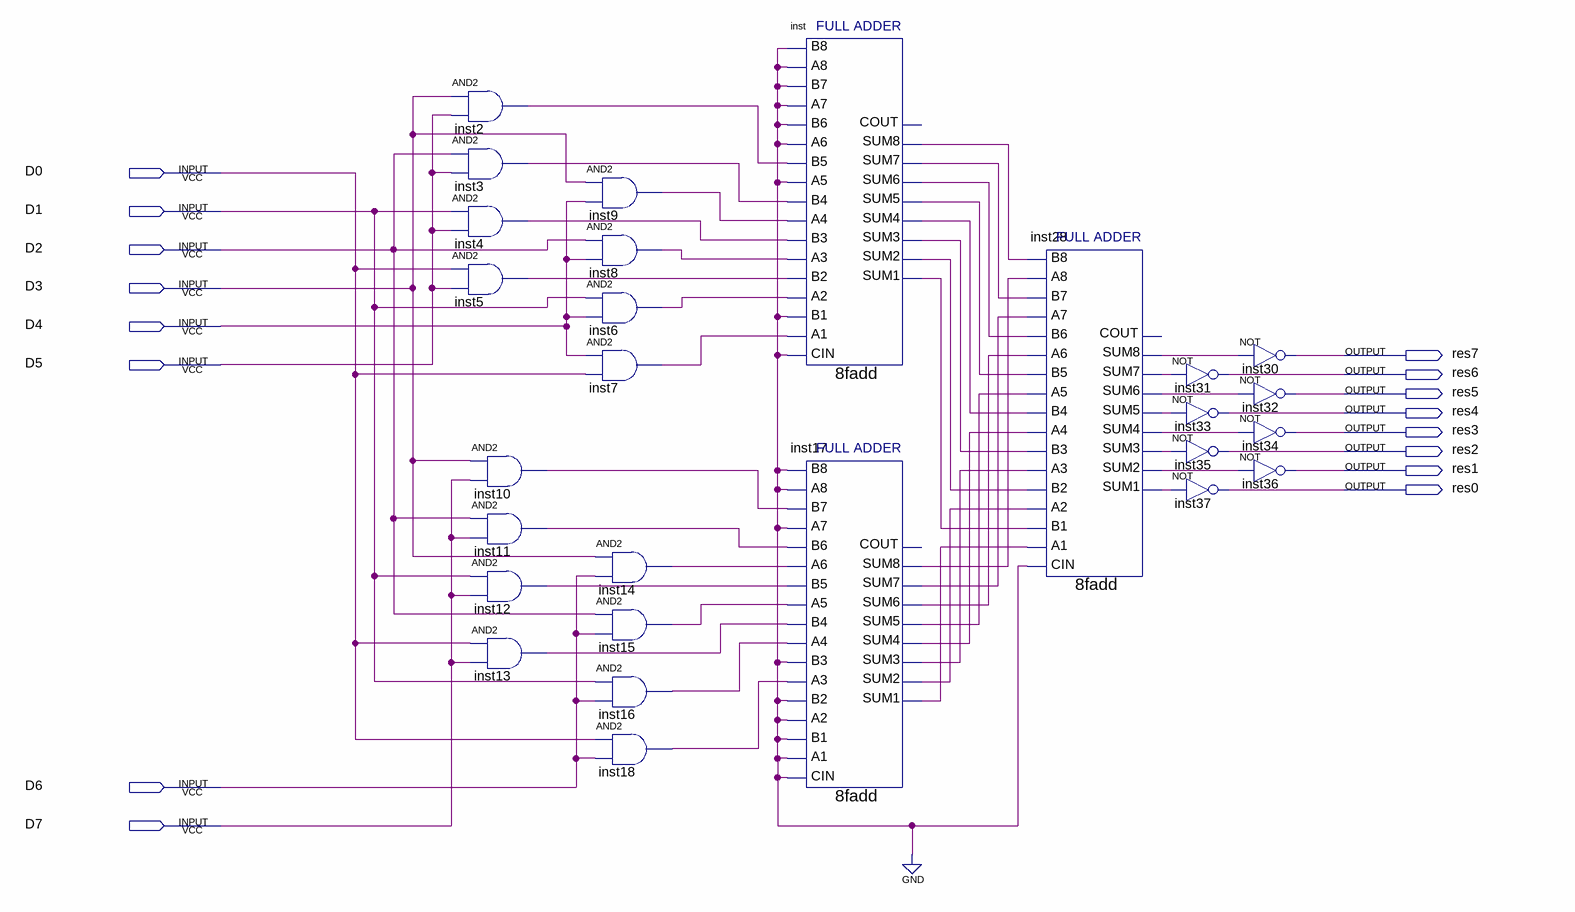
[diagram p0: schematic sheet]
// Quartus schematic Multiplier.bdf as structural Verilog: 27 symbols, 16 pins
module Multiplier (
  input  D0,
  input  D1,
  input  D2,
  input  D3,
  input  D4,
  input  D5,
  input  D6,
  input  D7,
  output res7,
  output res6,
  output res5,
  output res4,
  output res3,
  output res2,
  output res1,
  output res0
);

  wire inst2_out, inst3_out, inst4_out, inst5_out, inst6_out, inst7_out, inst8_out, inst9_out, inst10_out,
       inst11_out, inst12_out, inst13_out, inst14_out, inst15_out, inst16_out, inst17_sum1, inst17_sum2,
       inst17_sum3, inst17_sum4, inst17_sum5, inst17_sum6, inst17_sum7, inst17_sum8, inst18_out, inst28_sum1,
       inst28_sum2, inst28_sum3, inst28_sum4, inst28_sum5, inst28_sum6, inst28_sum7, inst28_sum8, inst_sum1,
       inst_sum2, inst_sum3, inst_sum4, inst_sum5, inst_sum6, inst_sum7, inst_sum8;

  and inst2 (inst2_out, D3, D5);
  and inst3 (inst3_out, D2, D5);
  and inst4 (inst4_out, D1, D5);
  and inst5 (inst5_out, D0, D5);
  and inst10 (inst10_out, D3, D7);
  and inst11 (inst11_out, D2, D7);
  and inst12 (inst12_out, D1, D7);
  and inst13 (inst13_out, D0, D7);
  and inst9 (inst9_out, D3, D4);
  and inst8 (inst8_out, D2, D4);
  and inst6 (inst6_out, D1, D4);
  and inst7 (inst7_out, D4, D0);
  and inst14 (inst14_out, D3, D6);
  and inst15 (inst15_out, D2, D6);
  and inst16 (inst16_out, D1, D6);
  and inst18 (inst18_out, D0, D6);
  \8fadd  inst (
    .A1(inst7_out), .A3(inst8_out), .CIN(1'b0), .B1(1'b0), .A2(inst6_out), .B2(inst5_out), .A4(inst9_out),
    .B4(inst3_out), .A5(1'b0), .A7(1'b0), .B6(1'b0), .B3(inst4_out), .B8(1'b0), .B5(inst2_out), .A6(1'b0),
    .B7(1'b0), .A8(1'b0), .SUM2(inst_sum2), .SUM5(inst_sum5), .SUM6(inst_sum6), .SUM1(inst_sum1),
    .SUM3(inst_sum3), .SUM4(inst_sum4), .SUM7(inst_sum7), .SUM8(inst_sum8));  // open: COUT
  \8fadd  inst17 (
    .A1(1'b0), .A3(inst18_out), .CIN(1'b0), .B1(1'b0), .A2(1'b0), .B2(1'b0), .A4(inst16_out),
    .B4(inst13_out), .A5(inst15_out), .A7(1'b0), .B6(inst11_out), .B3(1'b0), .B8(1'b0), .B5(inst12_out),
    .A6(inst14_out), .B7(inst10_out), .A8(1'b0), .SUM2(inst17_sum2), .SUM5(inst17_sum5), .SUM6(inst17_sum6),
    .SUM1(inst17_sum1), .SUM3(inst17_sum3), .SUM4(inst17_sum4), .SUM7(inst17_sum7), .SUM8(inst17_sum8));  // open: COUT
  \8fadd  inst28 (
    .A1(inst17_sum1), .A3(inst17_sum3), .CIN(1'b0), .B1(inst_sum1), .A2(inst17_sum2), .B2(inst_sum2),
    .A4(inst17_sum4), .B4(inst_sum4), .A5(inst17_sum5), .A7(inst17_sum7), .B6(inst_sum6), .B3(inst_sum3),
    .B8(inst_sum8), .B5(inst_sum5), .A6(inst17_sum6), .B7(inst_sum7), .A8(inst17_sum8), .SUM2(inst28_sum2),
    .SUM5(inst28_sum5), .SUM6(inst28_sum6), .SUM1(inst28_sum1), .SUM3(inst28_sum3), .SUM4(inst28_sum4),
    .SUM7(inst28_sum7), .SUM8(inst28_sum8));  // open: COUT
  not inst31 (res6, inst28_sum7);
  not inst33 (res4, inst28_sum5);
  not inst35 (res2, inst28_sum3);
  not inst37 (res0, inst28_sum1);
  not inst30 (res7, inst28_sum8);
  not inst32 (res5, inst28_sum6);
  not inst34 (res3, inst28_sum4);
  not inst36 (res1, inst28_sum2);
endmodule
